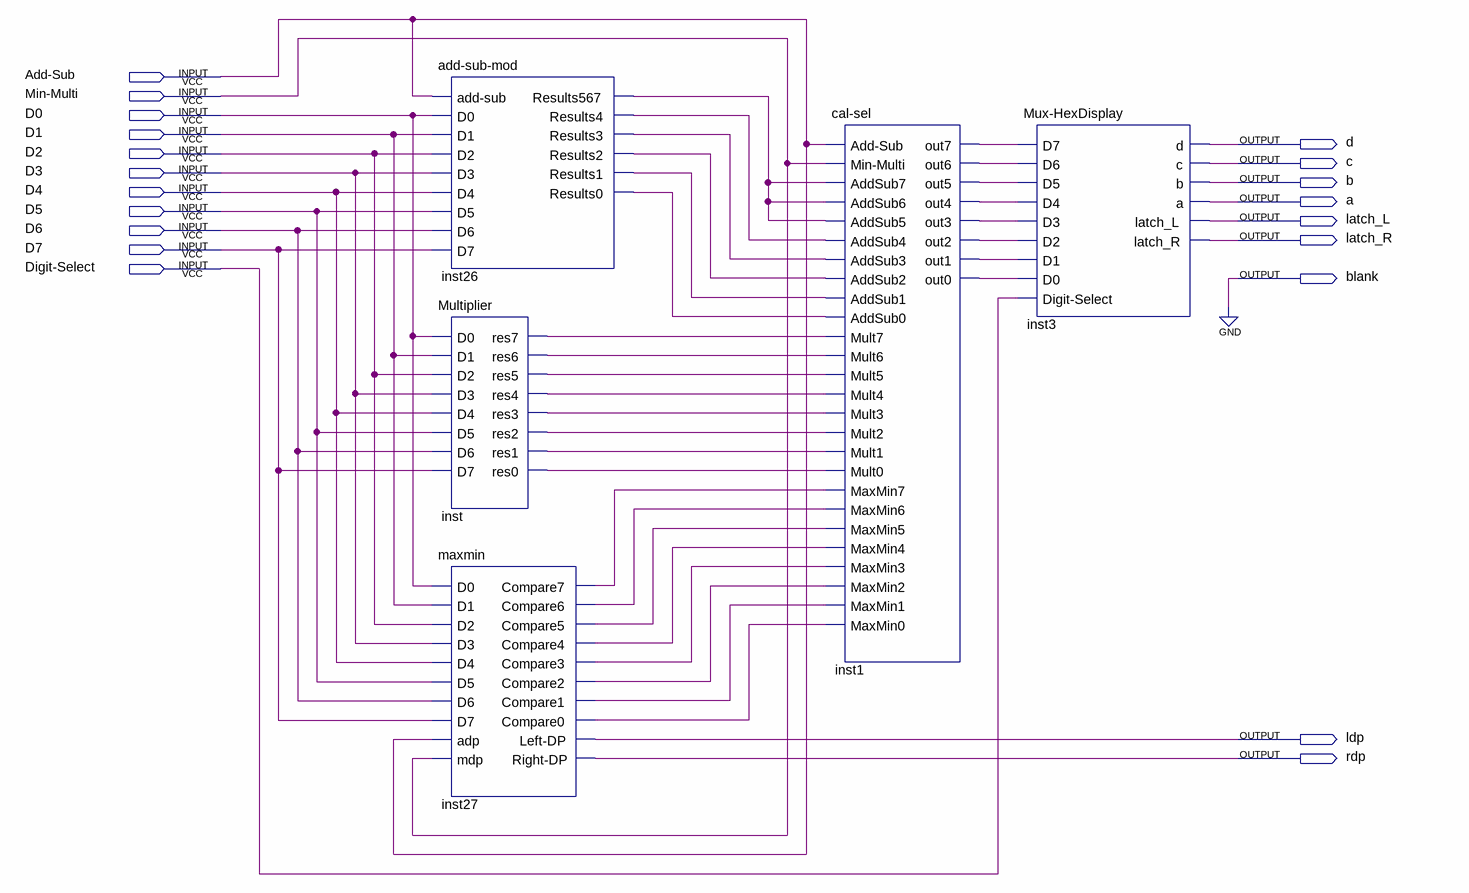
[diagram p0: schematic sheet]
// Quartus schematic Sub-cal.bdf as structural Verilog: 5 symbols, 20 pins
module \Sub-cal  (
  input  \Add-Sub ,
  input  \Min-Multi ,
  input  D0,
  input  D1,
  input  D2,
  input  D3,
  input  D4,
  input  D5,
  input  D6,
  input  D7,
  input  \Digit-Select ,
  output d,
  output c,
  output b,
  output a,
  output latch_L,
  output latch_R,
  output blank,
  output ldp,
  output rdp
);

  wire inst1_out0, inst1_out1, inst1_out2, inst1_out3, inst1_out4, inst1_out5, inst1_out6, inst1_out7,
       inst26_results0, inst26_results1, inst26_results2, inst26_results3, inst26_results4,
       inst26_results567, inst27_compare0, inst27_compare1, inst27_compare2, inst27_compare3,
       inst27_compare4, inst27_compare5, inst27_compare6, inst27_compare7, inst_res0, inst_res1, inst_res2,
       inst_res3, inst_res4, inst_res5, inst_res6, inst_res7;

  \add-sub-mod  inst26 (
    .\add-sub (\Add-Sub ), .D0(D0), .D1(D1), .D2(D2), .D3(D3), .D4(D4), .D5(D5), .D6(D6), .D7(D7),
    .Results567(inst26_results567), .Results4(inst26_results4), .Results3(inst26_results3),
    .Results2(inst26_results2), .Results1(inst26_results1), .Results0(inst26_results0));
  Multiplier inst (
    .D0(D0), .D1(D1), .D2(D2), .D3(D3), .D4(D4), .D5(D5), .D6(D6), .D7(D7), .res7(inst_res7),
    .res6(inst_res6), .res5(inst_res5), .res4(inst_res4), .res3(inst_res3), .res2(inst_res2),
    .res1(inst_res1), .res0(inst_res0));
  maxmin inst27 (
    .D0(D0), .D1(D1), .D2(D2), .D3(D3), .D4(D4), .D5(D5), .D6(D6), .D7(D7), .adp(\Add-Sub ),
    .mdp(\Min-Multi ), .Compare7(inst27_compare7), .Compare6(inst27_compare6), .Compare5(inst27_compare5),
    .Compare4(inst27_compare4), .Compare3(inst27_compare3), .Compare2(inst27_compare2),
    .Compare1(inst27_compare1), .Compare0(inst27_compare0), .\Left-DP (ldp), .\Right-DP (rdp));
  \cal-sel  inst1 (
    .\Add-Sub (\Add-Sub ), .\Min-Multi (\Min-Multi ), .AddSub7(inst26_results567),
    .AddSub6(inst26_results567), .AddSub5(inst26_results567), .AddSub4(inst26_results4),
    .AddSub3(inst26_results3), .AddSub2(inst26_results2), .AddSub1(inst26_results1),
    .AddSub0(inst26_results0), .Mult7(inst_res7), .Mult6(inst_res6), .Mult5(inst_res5), .Mult4(inst_res4),
    .Mult3(inst_res3), .Mult2(inst_res2), .Mult1(inst_res1), .Mult0(inst_res0), .MaxMin7(inst27_compare7),
    .MaxMin6(inst27_compare6), .MaxMin5(inst27_compare5), .MaxMin4(inst27_compare4),
    .MaxMin3(inst27_compare3), .MaxMin2(inst27_compare2), .MaxMin1(inst27_compare1),
    .MaxMin0(inst27_compare0), .out7(inst1_out7), .out6(inst1_out6), .out5(inst1_out5), .out4(inst1_out4),
    .out3(inst1_out3), .out2(inst1_out2), .out1(inst1_out1), .out0(inst1_out0));
  \Mux-HexDisplay  inst3 (
    .D7(inst1_out7), .D6(inst1_out6), .D5(inst1_out5), .D4(inst1_out4), .D3(inst1_out3), .D2(inst1_out2),
    .D1(inst1_out1), .D0(inst1_out0), .\Digit-Select (\Digit-Select ), .d(d), .c(c), .b(b), .a(a),
    .latch_L(latch_L), .latch_R(latch_R));

  assign blank = 1'b0;
endmodule
